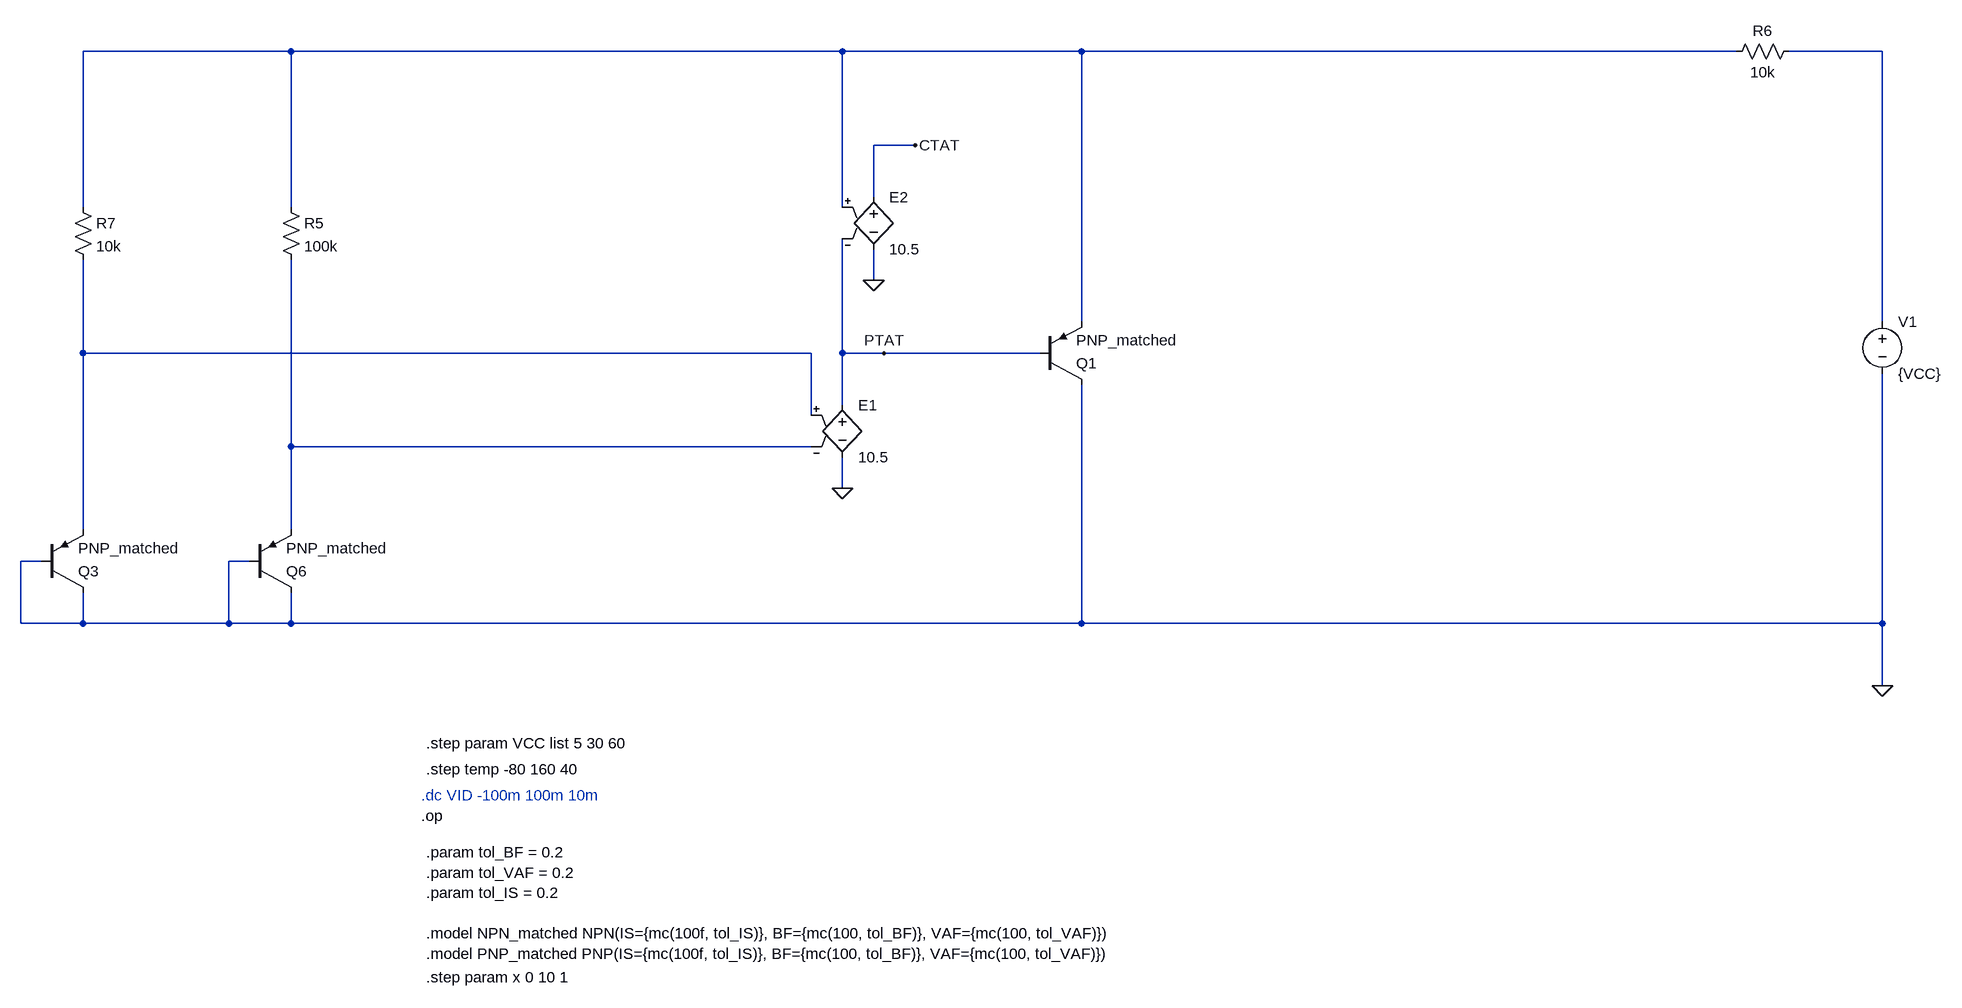
[diagram p0: schematic Draft4.asc]
Draft4.asc, the LTspice schematic file:
Version 4.1
SHEET 1 1652 992
WIRE -896 -768 -1216 -768
WIRE -48 -768 -896 -768
WIRE 320 -768 -48 -768
WIRE 1328 -768 320 -768
WIRE 1552 -768 1408 -768
WIRE 64 -624 0 -624
WIRE 0 -544 0 -624
WIRE -1216 -528 -1216 -768
WIRE -896 -528 -896 -768
WIRE -48 -528 -48 -768
WIRE 0 -416 0 -464
WIRE 320 -352 320 -768
WIRE 1552 -352 1552 -768
WIRE -1216 -304 -1216 -448
WIRE -96 -304 -1216 -304
WIRE -48 -304 -48 -480
WIRE 16 -304 -48 -304
WIRE 256 -304 16 -304
WIRE -48 -224 -48 -304
WIRE -96 -208 -96 -304
WIRE -896 -160 -896 -448
WIRE -96 -160 -896 -160
WIRE -48 -96 -48 -144
WIRE -1216 -32 -1216 -304
WIRE -896 -32 -896 -160
WIRE -1280 16 -1312 16
WIRE -960 16 -992 16
WIRE -1312 112 -1312 16
WIRE -1216 112 -1216 64
WIRE -1216 112 -1312 112
WIRE -992 112 -992 16
WIRE -992 112 -1216 112
WIRE -896 112 -896 64
WIRE -896 112 -992 112
WIRE 320 112 320 -256
WIRE 320 112 -896 112
WIRE 1552 112 1552 -272
WIRE 1552 112 320 112
WIRE 1552 208 1552 112
FLAG 1552 208 0
FLAG -48 -96 0
FLAG 16 -304 PTAT
FLAG 0 -416 0
FLAG 64 -624 CTAT
SYMBOL voltage 1552 -368 R0
WINDOW 123 0 0 Left 0
WINDOW 39 0 0 Left 0
SYMATTR InstName V1
SYMATTR Value {VCC}
SYMBOL pnp -1280 64 M180
SYMATTR InstName Q3
SYMATTR Value PNP_matched
SYMBOL res -1232 -544 R0
SYMATTR InstName R7
SYMATTR Value 10k
SYMBOL pnp -960 64 M180
SYMATTR InstName Q6
SYMATTR Value PNP_matched
SYMBOL res -912 -544 R0
SYMATTR InstName R5
SYMATTR Value 100k
SYMBOL res 1424 -784 R90
WINDOW 0 0 56 VBottom 2
WINDOW 3 32 56 VTop 2
SYMATTR InstName R6
SYMATTR Value 10k
SYMBOL e -48 -240 R0
SYMATTR InstName E1
SYMATTR Value 10.5
SYMBOL pnp 256 -256 M180
SYMATTR InstName Q1
SYMATTR Value PNP_matched
SYMBOL e 0 -560 R0
SYMATTR InstName E2
SYMATTR Value 10.5
TEXT -696 376 Left 2 ;.dc VID -100m 100m 10m
TEXT -688 336 Left 2 !.step temp -80 160 40
TEXT -688 464 Left 2 !.param tol_BF = 0.2\n.param tol_VAF = 0.2\n.param tol_IS = 0.2\n \n.model NPN_matched NPN(IS={mc(100f, tol_IS)}, BF={mc(100, tol_BF)}, VAF={mc(100, tol_VAF)})\n.model PNP_matched PNP(IS={mc(100f, tol_IS)}, BF={mc(100, tol_BF)}, VAF={mc(100, tol_VAF)})
TEXT -688 656 Left 2 !.step param x 0 10 1
TEXT -696 408 Left 2 !.op
TEXT -688 296 Left 2 !.step param VCC list 5 30 60

The netlist it stands for:
* Draft4.asc
V1 N002 0 {VCC}
Q3 0 0 N003 0 PNP_matched
R7 N001 N003 10k
Q6 0 0 N004 0 PNP_matched
R5 N001 N004 100k
R6 N002 N001 10k
E1 PTAT 0 N003 N004 10.5
Q1 0 PTAT N001 0 PNP_matched
E2 CTAT 0 N001 PTAT 10.5
.model NPN NPN
.model PNP PNP
.lib standard.bjt
* .dc VID -100m 100m 10m
.step temp -80 160 40
.param tol_BF = 0.2
.param tol_VAF = 0.2
.param tol_IS = 0.2
.model NPN_matched NPN(IS={mc(100f, tol_IS)}, BF={mc(100, tol_BF)}, VAF={mc(100, tol_VAF)})
.model PNP_matched PNP(IS={mc(100f, tol_IS)}, BF={mc(100, tol_BF)}, VAF={mc(100, tol_VAF)})
.step param x 0 10 1
.op
.step param VCC list 5 30 60
.backanno
.end